# EasyEDA Pro project 辅助电源.epro, schematic 12V
Board Name: 辅助电源(BUCK)2; Create Date: 2024-06-10; Page Name: P1; Project Name: 开关电源实验平台; Schematic Name: 12V; Update Date: 2024-12-12; Company: 嘉立创EDA; Page Size: A4; Version: V1.0
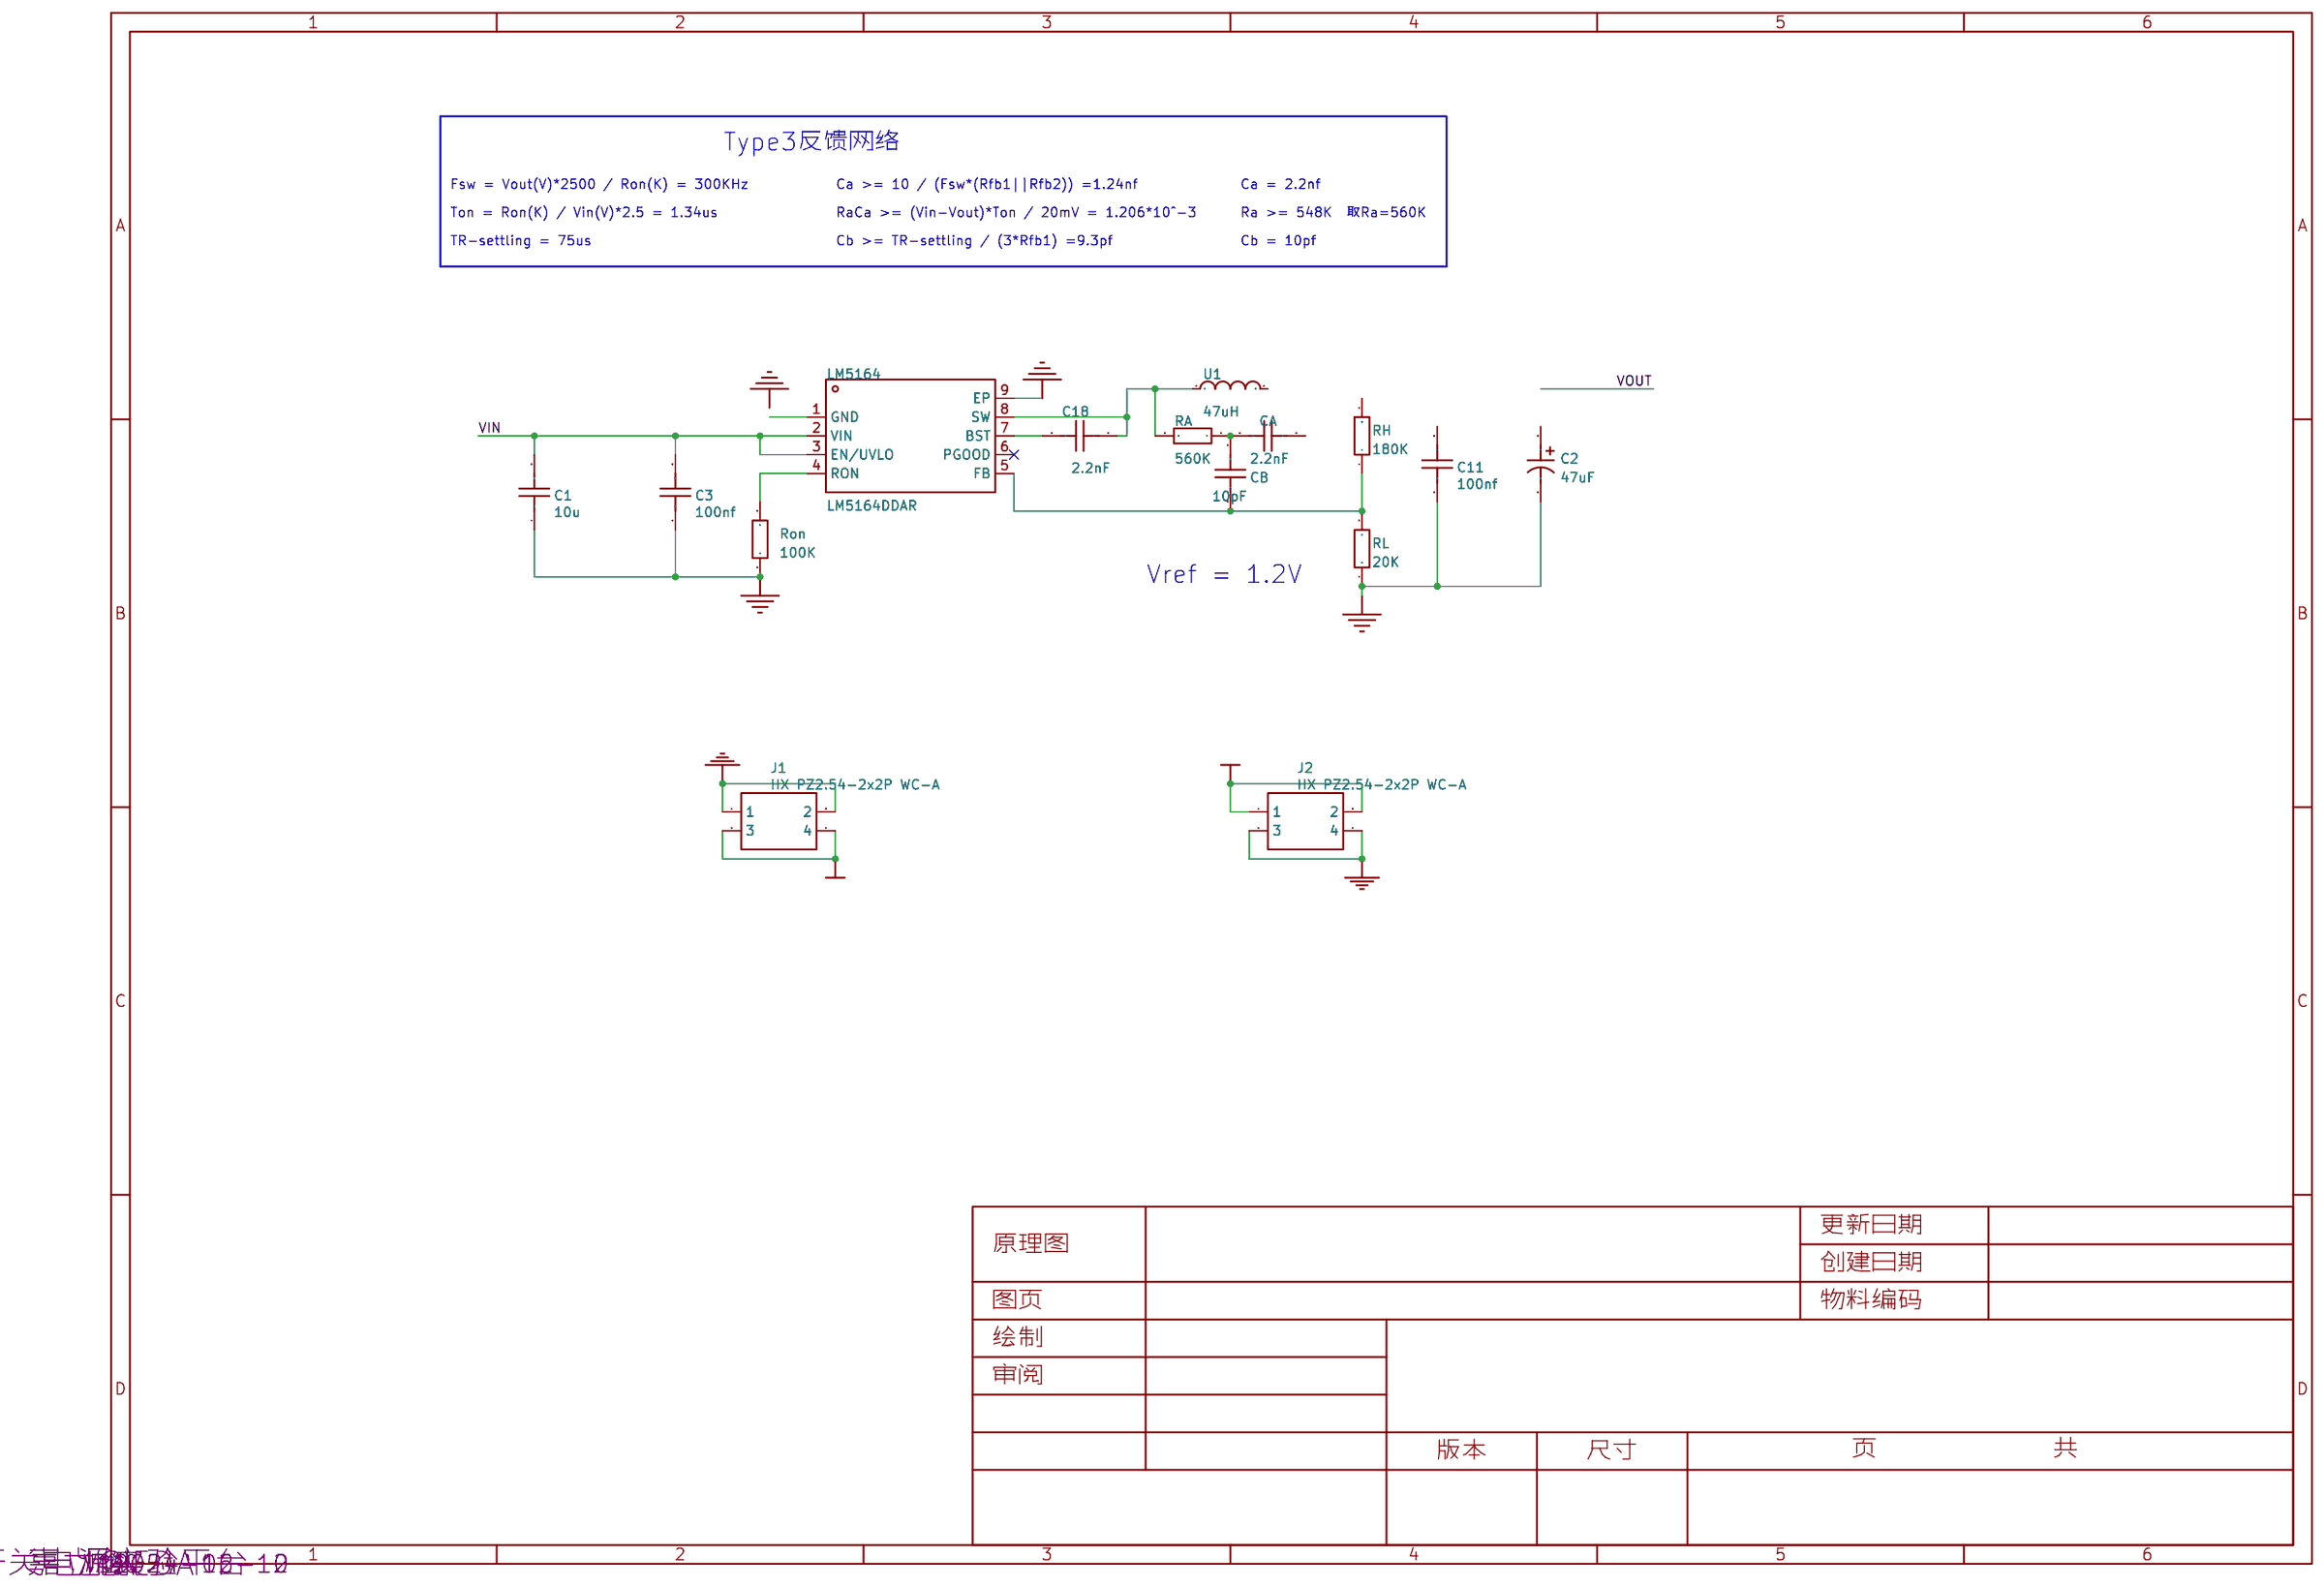
[diagram p0: schematic sheet]

## Parts
C1  10u  [C1206]
C2  47uF  [CAP-SMD_BD6.3-L6.6-W6.6-LS7.3-FD]
C3  100nf  [C1206]
C11  100nf  [C1206]
C18  2.2nF  [C0603]
CA  2.2nF  [C0603]
CB  10pF  [C0603]
J1  HX PZ2.54-2x2P WC-A  [HDR-TH_4P-P2.54-H-M-R2-C2-S2.54-W10.0]
J2  HX PZ2.54-2x2P WC-A  [HDR-TH_4P-P2.54-H-M-R2-C2-S2.54-W10.0]
LM5164  LM5164DDAR  [SO-8_L4.9-W3.9-P1.27-LS6.0-BL-EP]
RA  560K  [R0805]
RH  180K  [R0805]
RL  20K  [R0805]
Ron  100K  [R0805]
U1  47uH  [IND-SMD_L11.0-W10.2]

## Library data of the parts
C1 = 10u: link: https://item.szlcsc.com/89171.html; 3DModel: C1206_L3.2-W1.6-H1.3
C2 = RV50V47M6X5: 容值:47uF;精度:±20%;额定电压:50V;纹波电流:50mA@120Hz;; LCSC Part Name: 47uF ±20% 50V; Supplier Part: C48971023; Manufacturer: JIERR(捷而瑞); Supplier Footprint: SMD,D6.3xL5.4mm; JLCPCB Part Class: Extended Part; Datasheet: https://item.szlcsc.com/datasheet/RV50V47M6X5/51296228.html; Supplier: LCSC; Tolerance: ±20%; Voltage Rating: 50V; Ripple Current: 50mA@120Hz; Diameter: 6.3mm; Height - Seated (Max): 5.4mm; Lifetime: 2000hrs@105℃; Operating Temperature: -40℃~+105℃
C3 C11 = 1u: link: https://item.szlcsc.com/89171.html; 3DModel: C1206_L3.2-W1.6-H1.3
C18 CA CB = CAP_0603: Supplier Footprint: 0603
J1 J2 = HX PZ2.54-2x2P WC-A: 插针结构:2x2P;间距:2.54mm;行距:2.54mm;圆针/方针:方针;安装方式:弯插;排数:双排;总PIN位数:4P;额定电流:3A;额定电压:1kV;配合针长度:6mm;塑高:2.5mm;端接针长度:3mm;触头材质:黄铜;触头镀层:金;工作温度:-40℃~+105℃;颜色:黑色;; LCSC Part Name: 2x2P 间距:2.54mm 方针 弯插; Supplier Part: C41417350; Manufacturer: hanxia(韩下); Supplier Footprint: 弯插,P=2.54mm; JLCPCB Part Class: 扩展库; Datasheet: https://item.szlcsc.com/datasheet/HX%2520PZ2.54-2x2P%2520WC-A/43243354.html; Supplier: LCSC; Pin Structure: 2x2P; Pitch: 2.54mm; Row Spacing: 2.54mm; Circluar Pins/Square Pins: 方针; Mounting Type: 弯插; Number of Rows: 双排; Number of Pins: 4P; Current Rating: 3A; Voltage Rating (Max): 1kV; Length of Mating Pin: 6mm; Insulation Height: 2.5mm; Length of End Connection Pin: 3mm; Contact Material: 黄铜; Contact Plating: 金; Operating Temperature: -40℃~+105℃; Color: 黑色
LM5164 = LM5164DDAR: 功能类型:降压型;输出类型:可调;输入电压:6V~100V;输出电压:1.2V~100V;输出电流(最大值):1A;; LCSC Part Name: 降压型 输入6V~100V 输出1.2V~100V 1A; Supplier Part: C477928; Manufacturer: TI(德州仪器); Supplier Footprint: SO-8-EP; JLCPCB Part Class: Extended Part; Datasheet: https://atta.szlcsc.com/upload/public/pdf/source/20200102/C477928_A6130A40DCA2C193067E68A47DE8CF0C.pdf; Supplier: LCSC; Function: 降压型; Synchronous Rectification: 是; Output Type: 可调; Number of Outputs: 1; Topology: 降压式; Input Voltage: 6V~100V; Output Voltage: 1.2V~100V; Output Current (Max): 1A; Switching Frequency: 1MHz; Operating Temperature: -40℃~+150℃@(TJ)
RA RH RL Ron = Res_0805: Supplier Footprint: 0805
U1 = CXP1050-4R7M-AG(4.7uh): 电感值:4.7uH;精度:±20%;额定电流:9.5A;饱和电流(Isat):15A;类型:一体成型电感;; LCSC Part Name: 4.7uH ±20% 15A; Supplier Part: C7461389; Manufacturer: DMBJ(振宝佳); Supplier Footprint: 1050; JLCPCB Part Class: 扩展库; Datasheet: https://atta.szlcsc.com/upload/public/pdf/source/20230706/7F3A5B39C5AD80A91C9FA782B54A296B.pdf; Supplier: LCSC; Tolerance: ±20%; Rated Current: 9.5A; Saturation Current (Isat): 15A; DC Resistance (DCR): 15mΩ; Type: 一体成型电感

## Nets
GND: C1.1 C2.2 C3.1 C11.1 J1.1 J1.2 J2.3 J2.4 LM5164.1(GND) LM5164.9(EP) RL.1 Ron.1
VIN: C1.2 C3.2 J1.3 J1.4 LM5164.2(VIN) LM5164.3(EN/UVLO)
VOUT: C2.1 C11.2 CA.2 J2.1 J2.2 RH.2 U1.2
$1N503: LM5164.4(RON) Ron.2
$1N505: CB.1 LM5164.5(FB) RH.1 RL.2
$1N506: C18.2 LM5164.7(BST)
$1N507: C18.1 LM5164.8(SW) RA.2 U1.1
$1N1696: CA.1 CB.2 RA.1

Not connected (* = marked no-connect by the designer): LM5164 6(PGOOD)*

## Notes on the sheet
- Type3反馈网络
- Fsw = Vout(V)*2500 / Ron(K) = 300KHz
- Ca >= 10 / (Fsw*(Rfb1||Rfb2)) =1.24nf
- Ca = 2.2nf
- Ton = Ron(K) / Vin(V)*2.5 = 1.34us
- RaCa >= (Vin-Vout)*Ton / 20mV = 1.206*10^-3
- Ra >= 548K  取Ra=560K
- TR-settling = 75us
- Cb >= TR-settling / (3*Rfb1) =9.3pf
- Cb = 10pf
- Vref = 1.2V
